# Altium schematic sheet MLX_Thermometer.SchDoc
size 635 x 599 mm
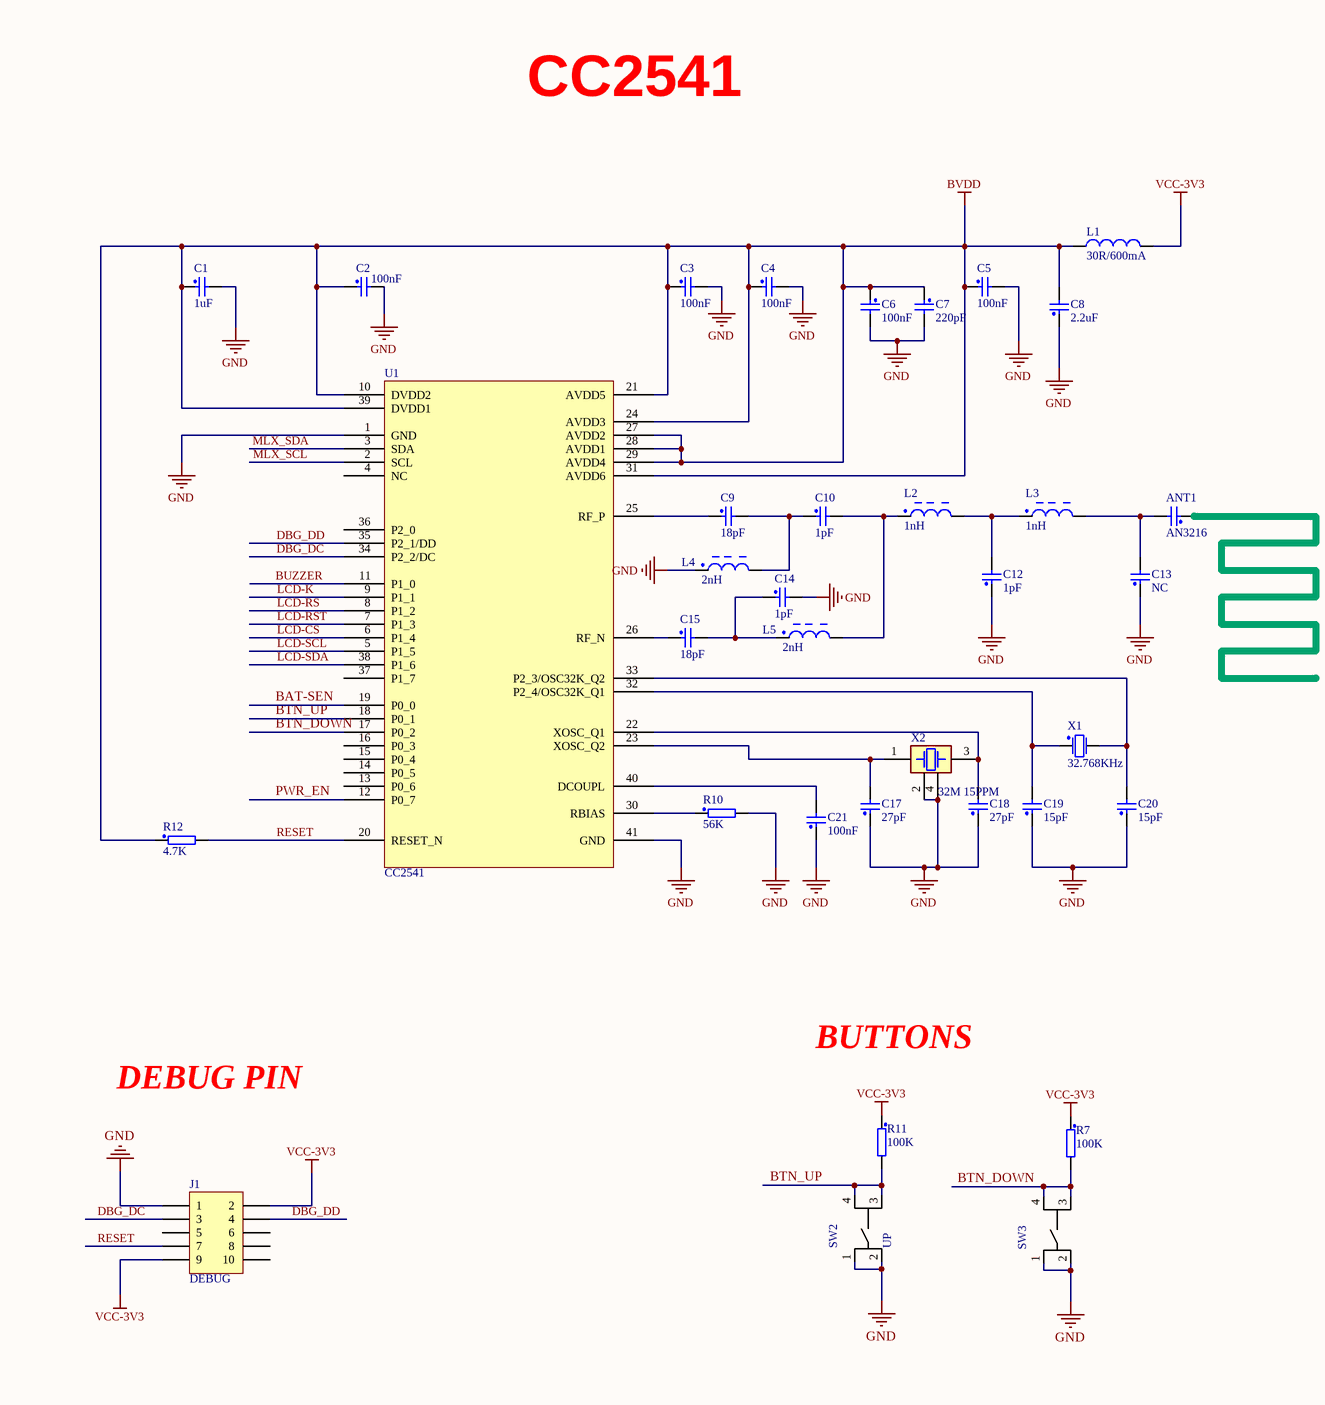
[diagram p0: MLX_Thermometer.SchDoc, top left]
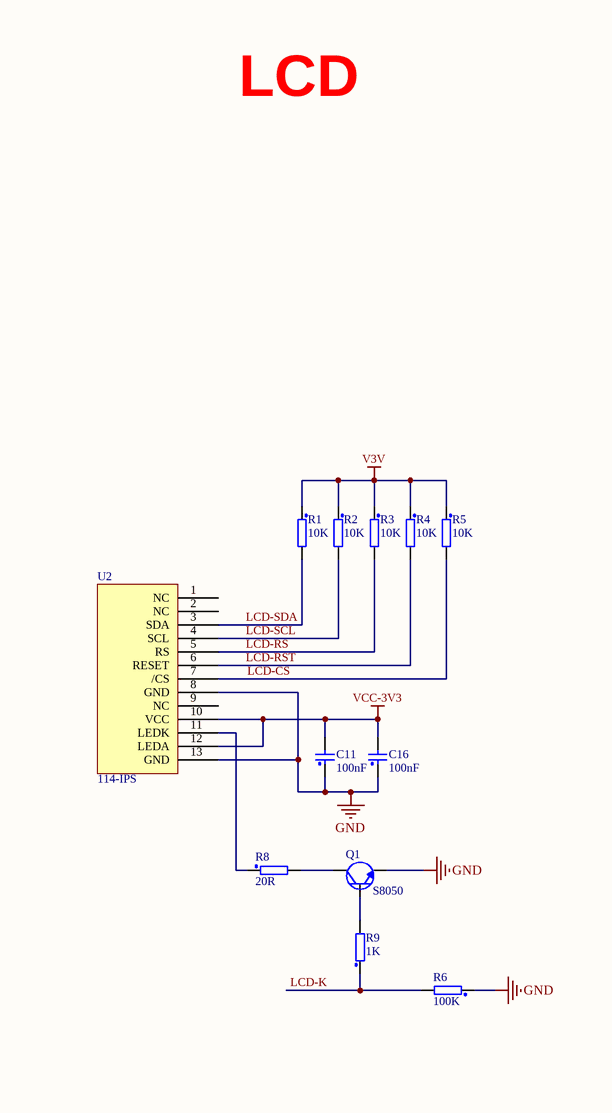
[diagram p1: MLX_Thermometer.SchDoc, top right]
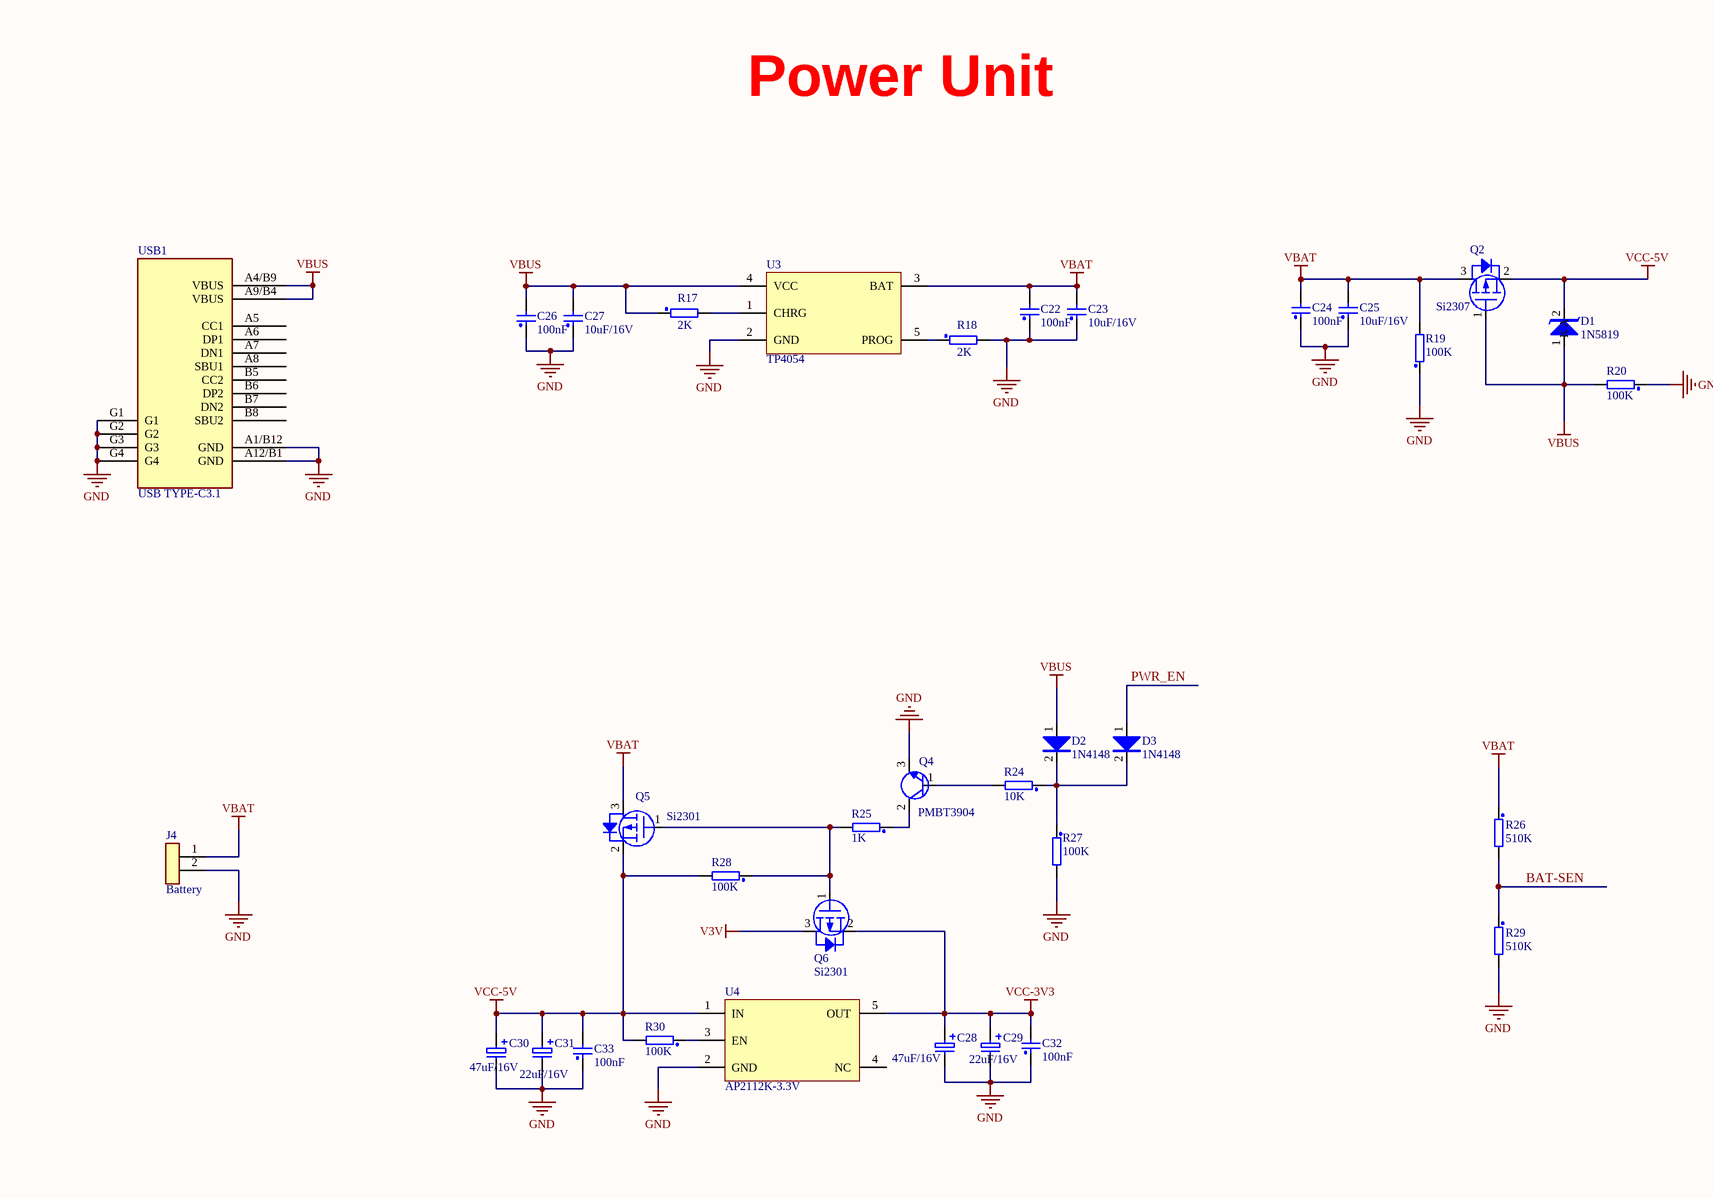
[diagram p2: MLX_Thermometer.SchDoc, bottom left]
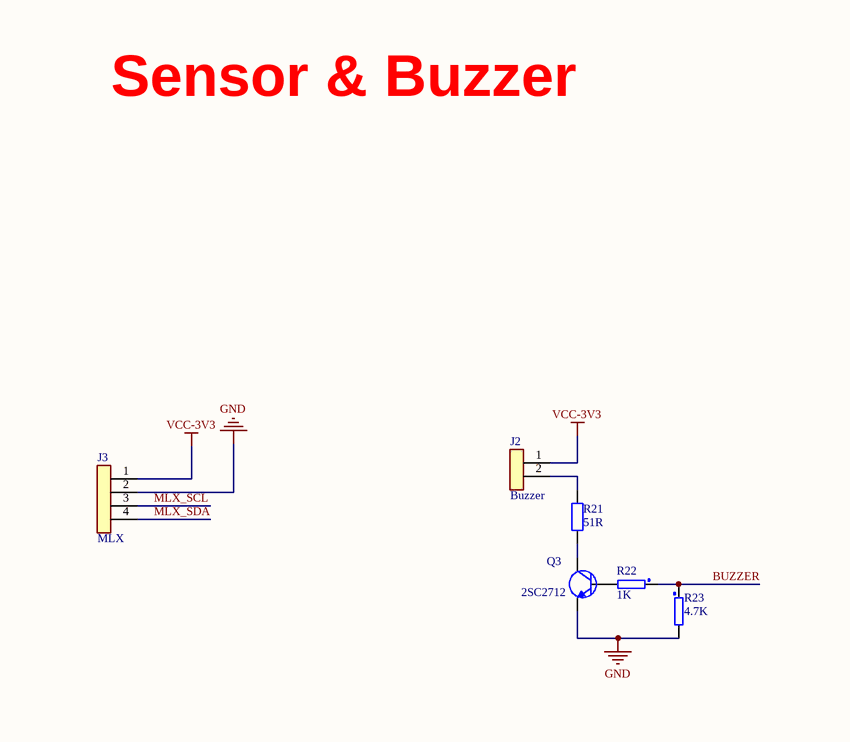
[diagram p3: MLX_Thermometer.SchDoc, bottom right]

## Parts
ANT1  AN3216  [AN3216]
C1  1uF  [CAP-0402]
C2  100nF  [CAP-0402]
C3  100nF  [CAP-0402]
C4  100nF  [CAP-0402]
C5  100nF  [CAP-0402]
C6  100nF  [CAP-0402]
C7  220pF  [CAP_0402]
C8  2.2uF  [CAP_0402]
C9  18pF  [CAP_0402]
C10  1pF  [CAP_0402]
C11  100nF  [CAP_0402]
C12  1pF  [CAP_0402]
C13  NC  [CAP_0402]
C14  1pF  [CAP_0402]
C15  18pF  [CAP_0402]
C16  100nF  [CAP_0402]
C17  27pF  [CAP_0402]
C18  27pF  [CAP_0402]
C19  15pF  [CAP_0402]
C20  15pF  [CAP_0402]
C21  100nF  [CAP-0402]
C22  100nF  [CAP_0402]
C23  10uF/16V  [CAP-0603]
C24  100nF  [CAP_0402]
C25  10uF/16V  [CAP-0603]
C26  100nF  [CAP_0402]
C27  10uF/16V  [CAP-0603]
C28  47uF/16V  [CAP-1206]
C29  22uF/16V  [CAP-1206]
C30  47uF/16V  [CAP-1206]
C31  22uF/16V  [CAP-1206]
C32  100nF  [CAP_0402]
C33  100nF  [CAP_0402]
D1  1N5819  [SOD523]
D2  1N4148  [SOD523-3D]
D3  1N4148  [SOD523-3D]
J1  DEBUG  [HEADER2X5]
J2  Buzzer  [MX 1.25-WS-2P]
J3  MLX  [MX 1.25-WS-4P]
J4  Battery  [MX 1.25-WS-2P]
L1  30R/600mA  [IND_0805_SMD]
L2  1nH  [Inductor_0402_3D]
L3  1nH  [Inductor_0402_3D]
L4  2nH  [Inductor_0402_3D]
L5  2nH  [Inductor_0402_3D]
Q1  S8050  [SOT23_2]
Q2  Si2307  [SOT23_2]
Q3  2SC2712  [SOT23_2]
Q4  PMBT3904  [SOT23_2]
Q5  Si2301  [SOT23_2]
Q6  Si2301  [SOT23_2]
R1  10K  [RES_0402]
R2  10K  [RES_0402]
R3  10K  [RES_0402]
R4  10K  [RES_0402]
R5  10K  [RES_0402]
R6  100K  [RES_0402]
R7  100K  [RES_0402]
R8  20R  [RES_0402]
R9  1K  [RES_0402]
R10  56K  [RES_0402]
R11  100K  [RES_0402]
R12  4.7K  [RES_0402]
R17  2K  [RES_0402]
R18  2K  [RES_0402]
R19  100K  [RES_0402]
R20  100K  [RES_0402]
R21  51R  [RES_0402]
R22  1K  [RES_0402]
R23  4.7K  [RES_0402]
R24  10K  [RES_0402]
R25  1K  [RES_0402]
R26  510K  [RES_0402]
R27  100K  [RES_0402]
R28  100K  [RES_0402]
R29  510K  [RES_0402]
R30  100K  [RES_0402]
SW2  UP  [SW_TVAF02A]
SW3  DOWN  [SW_TVAF02A]  (value not drawn)
U1  CC2541  [QFN50P600X600-40WL]
U2  114-IPS  [144-IPS]
U3  TP4054  [TP4054]
U4  AP2112K-3.3V  [AP2112K]
USB1  USB TYPE-C3.1  [USB-C]
X1  32.768KHz  [Crystal1206]
X2  32M 15PPM  [CRYSTAL_4-LCC]

## Nets
BVDD: C1.1 C2.1 C3.1 C4.1 C5.1 C6.1 C7.1 C8.2 L1.1 R12.1 U1.10(DVDD2) U1.21(AVDD5) U1.24(AVDD3) U1.27(AVDD2) U1.28(AVDD1) U1.29(AVDD4) U1.31(AVDD6) U1.39(DVDD1)
GND: C1.2 C2.2 C3.2 C4.2 C5.2 C6.2 C7.2 C8.1 C11.1 C12.1 C13.1 C14.2 C16.1 C17.1 C18.1 C19.1 C20.1 C21.1 C22.1 C23.1 C24.1 C25.1 C26.1 C27.1 C28.2 C29.2 C30.2 C31.2 C32.1 C33.1 J1.1 J3.2 J4.2 L4.1 Q1.3(E) Q3.3(E) Q4.3(E) R6.1 R10.2 R18.2 R19.1 R20.1 R23.2 R27.2 R29.2 SW2.1 SW2.2 SW3.1 SW3.2 U1.1(GND) U1.41(GND) U2.8(GND) U2.13(GND) U3.2(GND) U4.2(GND) USB1.A1/B12(GND) USB1.A12/B1(GND) USB1.G1 USB1.G2 USB1.G3 USB1.G4 X2.2 X2.4
V3V: Q6.3 R1.1 R2.1 R3.1 R4.1 R5.1
VBAT: C22.2 C23.2 C24.2 C25.2 J4.1 Q2.3 Q5.3 R19.2 R26.1 U3.3(BAT)
VBUS: C26.2 C27.2 D1.1(A) D2.1 Q2.1 R17.1 R20.2 U3.4(VCC) USB1.A4/B9(VBUS) USB1.A9/B4(VBUS)
VCC-3V3: C11.2 C16.2 C28.1 C29.1 C32.2 J1.2 J1.9 J2.1 J3.1 L1.2 Q6.2 R7.1 R11.1 U2.10(VCC) U2.12(LEDA) U4.5(OUT)
VCC-5V: C30.1 C31.1 C33.2 D1.2(K) Q2.2 Q5.2 R28.2 R30.2 U4.1(IN)
BAT-SEN: R26.2 R29.1 U1.19(P0_0)
BTN_DOWN: R7.2 SW3.3 SW3.4 U1.17(P0_2)
BTN_UP: R11.2 SW2.3 SW2.4 U1.18(P0_1)
BUZZER: R22.1 R23.1 U1.11(P1_0)
DBG_DC: J1.3 U1.34(P2_2/DC)
DBG_DD: J1.4 U1.35(P2_1/DD)
LCD-CS: R5.2 U1.6(P1_4) U2.7(/CS)
LCD-K: R6.2 R9.1 U1.9(P1_1)
LCD-RS: R3.2 U1.8(P1_2) U2.5(RS)
LCD-RST: R4.2 U1.7(P1_3) U2.6(RESET)
LCD-SCL: R2.2 U1.5(P1_5) U2.4(SCL)
LCD-SDA: R1.2 U1.38(P1_6) U2.3(SDA)
MLX_SCL: J3.3 U1.2(SCL)
MLX_SDA: J3.4 U1.3(SDA)
PWR_EN: D3.1 U1.12(P0_7)
RESET: J1.7 R12.2 U1.20(RESET_N)
NetANT1_2: ANT1.2 C13.2 L3.2
NetC9_1: C9.1 U1.25(RF_P)
NetC9_2: C9.2 C10.1 L4.2
NetC10_2: C10.2 L2.1 L5.2
NetC12_2: C12.2 L2.2 L3.1
NetC14_1: C14.1 C15.2 L5.1
NetC15_1: C15.1 U1.26(RF_N)
NetC17_2: C17.2 U1.23(XOSC_Q2) X2.1
NetC18_2: C18.2 U1.22(XOSC_Q1) X2.3
NetC19_2: C19.2 U1.32(P2_4/OSC32K_Q1) X1.1(P1)
NetC20_2: C20.2 U1.33(P2_3/OSC32K_Q2) X1.2(P2)
NetC21_2: C21.2 U1.40(DCOUPL)
NetD2_2: D2.2 D3.2 R24.1 R27.1
NetJ2_2: J2.2 R21.1
NetQ1_1: Q1.1(C) R9.2
NetQ1_2: Q1.2(B) R8.2
NetQ3_1: Q3.1(C) R22.2
NetQ3_2: Q3.2(B) R21.2
NetQ4_1: Q4.1(C) R24.2
NetQ4_2: Q4.2(B) R25.1
NetQ5_1: Q5.1 Q6.1 R25.2 R28.1
NetR8_1: R8.1 U2.11(LEDK)
NetR10_1: R10.1 U1.30(RBIAS)
NetR17_2: R17.2 U3.1(CHRG)
NetR18_1: R18.1 U3.5(PROG)
NetR30_1: R30.1 U4.3(EN)

Not connected (* = marked no-connect by the designer): ANT1 1; J1 5 6 8 10; U1 4(NC) 13(P0_6) 14(P0_5) 15(P0_4) 16(P0_3) 36(P2_0) 37(P1_7); U2 1(NC) 2(NC) 9(NC); U4 4(NC); USB1 A5(CC1) A6(DP1) A7(DN1) A8(SBU1) B5(CC2) B6(DP2) B7(DN2) B8(SBU2)

## Notes on the sheet
- CC2541
- LCD
- BUTTONS
- DEBUG PIN
- Power Unit
- Sensor & Buzzer

## Library data of the parts
ANT1 = CAP: AN3216-245 2.4G BLE Antenna; MF: *; MP: *; Package: *; value: *; TaoBao_Purchase_URL: https://detail.tmall.com/item.htm?spm=a230r.1.14.8.96184f13HPWBwH&id=521488309682&cm_id=140105335569ed55e27b&abbucket=16; Digi-Key_Purchase_URL: *; Digi-Key_Part_Number: *
C1 = CAP: Capacitor; value: 6.3V/iuF; Package: 0402
C2-C6 C21 = CAP: Capacitor; value: 16V/100nF; Package: 0402
C7 = CAP: Capacitor; value: 50V/220pF; Package: 0402
C8 = CAP: Capacitor; value: 6.3V/2.2uF; Package: 0402
C9 C15 = CAP: Capacitor; value: 50V/18pF; Package: 0402
C10 C12 C14 = CAP: Capacitor; value: 50V/1pF; Package: 0402
C11 C16 C19 C20 C22-C27 C32 C33 = CAP: Capacitor; value: 50V/15pF; Package: 0402
C13 = CAP: Capacitor
C17 C18 = CAP: Capacitor; value: 50V/27pF; Package: 0402
C28-C31 = CAP_POLAR: Capacitor; Manufacturer: Vishay Sprague; MPN: T55D107M025C0060; Value: 25V/100uF(T55D107M025C0060); Digi-Key Partnumber: 718-2173-1-ND; Package: 2917 (7343 Metric)
D1 = ZENER: ZENER DIODE; value: BZX585-B9V1; Package: SOD523
D2 D3 = DIODE: DIODE SCHOTTKY; MF: STMicroelectronics; value: 30V/300MA; MP: BAT30KFILM; Digi-Key_Part_Number: 497-5552-2-ND; Package: SOD523; Digi-Key_Purchase_URL: https://www.digikey.com/product-detail/en/stmicroelectronics/BAT30KFILM/497-5552-2-ND/1207019; TaoBao_Purchase_URL: https://detail.tmall.com/item.htm?spm=a230r.1.14.1.17442803eJRhGB&id=577412855490&cm_id=140105335569ed55e27b&abbucket=18
J1 = Header2x5
J2 J4 = HEADER2_1
J3 = HEADER4
L1 = Inductor: FIXED IND 4.7UH 600MA 180 MOHM; MF: TDK Corporation; MP: MLZ2012N4R7LT000; Package: 0805 (2012 Metric); value: 4.7UH 600MA; TaoBao_Purchase_URL: https://detail.tmall.com/item.htm?spm=a230r.1.14.1.2e803235NwWsDc&id=524061179119&cm_id=140105335569ed55e27b&abbucket=16; Digi-Key_Purchase_URL: https://www.digikey.com/product-detail/en/tdk-corporation/MLZ2012N4R7LT000/445-6760-2-ND/2523498; Digi-Key_Part_Number: 445-6760-2-ND
L2 L3 = INDUCTOR: FIXED IND 1NH 1.2A 30 MOHM SMD; MF: TDK Corporation; MP: MHQ1005P1N0BT000; value: 1nH±0.1nH; Package: 0402 (1006 Metric); Digi-Key_Part_Number: 445-175574-2-ND; Digi-Key_Purchase_URL: https://www.digikey.com/product-detail/en/tdk-corporation/MHQ1005P1N0BT000/445-175574-2-ND/4742515; TaoBao_Purchase_URL: https://detail.tmall.com/item.htm?spm=a230r.1.14.21.1a71364fWEdiUS&id=577554439239&ns=1&abbucket=16
L4 L5 = INDUCTOR: FIXED IND 2NH 900MA 150 MOHM SMD; MF: TDK Corporation; MP: MLG1005S2N0BT000; value: 2nH ±0.1nH; Package: 0402 (1005 Metric); TaoBao_Purchase_URL: https://detail.tmall.com/item.htm?spm=a230r.1.14.1.11227b88Hif0cT&id=558199830076&cm_id=140105335569ed55e27b&abbucket=16; Digi-Key_Purchase_URL: https://www.digikey.com/product-detail/en/tdk-corporation/MLG1005S2N0BT000/445-16277-2-ND/4742727; Digi-Key_Part_Number: 445-16277-2-ND
Q1 Q4 = NPN: NPN BJT; Manufacturer: Toshiba Semiconductor and Storage; MPN: 2SC2712-GR,LF; TemperatureRange: 125°C (TJ); Value: 2SC2712-GR,LF; AN: *; Hight: *; Design Comment: *; Partgroup: *; Supplier_1: Digi-Key; Supplier_1_PN: 2SC2712-GRLFCT-ND; Supplier_2: Farnell; Supplier_2_PN: *; Package: SOT-23-3; Taobao_URL: https://detail.tmall.com/item.htm?spm=a230r.1.14.35.444f2c38iRqyPU&id=520601925531&ns=1&abbucket=7
Q2 Q5 Q6 = MOS-P-D: P-Channel Mosfet 20V/4.3A; Manufacturer: Alpha & Omega Semiconductor Inc.; MPN: AO3401A; TemperatureRange: -55°C ~ 150°C (TJ); Value: AO3407A; AN: *; Hight: *; Design Comment: *; Partgroup: *; Supplier_1: Digi-Key; Supplier_1_PN: 785-1001-1-ND; Supplier_2: Farnell; Supplier_2_PN: *; Package: SOT-23-3; Taobao_URL: https://detail.tmall.com/item.htm?spm=a230r.1.14.13.1b167e0bkw5ajU&id=25040792997&cm_id=140105335569ed55e27b&abbucket=7
Q3 = NPN: NPN BJT
R1-R9 R11 R17-R20 R24 R25 R27 R28 R30 = RES: Resistor; Manufacturer: Yageo; MPN: RC0402FR-071KL; Hight: 0.016" (0.40mm); TemperatureRange: -55°C ~ 155°C; Value: 1K ±1%; AN: *; Design Comment: *; Partgroup: *; Supplier_1: Digi-Key; Supplier_1_PN: 311-1.00KLRTR-ND; Supplier_2: Farnell; Supplier_2_PN: *; Package: 0402; Taobao_URL: *
R10 = RES: Resistor; value: 56K± 1%; Package: 0402
R12 = RES: Resistor; value: 4.7K± 1%; Package: 0402
R21 = Res2: Resistor; Published: 8-Jun-2000; LatestRevisionDate: 17-Jul-2002; LatestRevisionNote: Re-released for DXP Platform.; PackageReference: AXIAL-0.4; Publisher: Altium Limited
R22 R23 = RES: Resistor
R26 R29 = RES: Resistor; value: 510K± 1%; Package: 0402; Digi-Key_Purchase_URL: **; Digi-Key_Part_Number: ***; TaoBao_Purchase_URL: *
SW2 SW3 = 1-1825910-4: Tactile Switch SPST-NO Top Actuated Surface Mount; MP: PTS810 SJM 250 SMTR LFS; MF: C&K; Package: Tape & Reel (TR); Digi-Key_Purchase_URL: https://www.digikey.com/product-detail/en/c-k/PTS810-SJM-250-SMTR-LFS/CKN10502TR-ND/4176610; Digi-Key_Part_Number: CKN10502TR-ND; TaoBao_Purchase_URL: https://item.taobao.com/item.htm?spm=a230r.1.14.15.fa6569a9PYJGfN&id=559379919837&ns=1&abbucket=18#detail
U1 = CC2541: IC RF TXRX+MCU BLUETOOTH 40VFQFN; MF: Texas Instruments; MP: CC2541F256RHAR; value: CC2541F256; Package: 40-VFQFN Exposed Pad; Digi-Key_Part_Number: 296-37144-2-ND; Digi-Key_Purchase_URL: https://www.digikey.com/product-detail/en/texas-instruments/CC2541F256RHAR/296-37144-2-ND/3030900; TaoBao_Purchase_URL: https://detail.tmall.com/item.htm?spm=a230r.1.14.1.64d0617eBmgGPQ&id=39306964037&cm_id=140105335569ed55e27b&abbucket=16
U2 = 114-IPS: 1.14 TFT IPS
USB1 = USB TYPE-C3.1: CONN RCP USB3.1 TYPEC SMD; TaoBao_Purchase_URL: https://item.taobao.com/item.htm?spm=a230r.1.14.1.6a515b38czXcyl&id=573090887123&ns=1&abbucket=18#detail; MP: *; MF: *; Digi-Key_Part_Number: *; Digi-Key_Purchase_URL: *; value: *; Package: *
X1 = CRYSTAL: CRYSTAL 32.7680 KHZ 12.5PF SMD; MF: EPSON; MP: FC-135 32.7680KA-A5; value: 32.768kHz ±20ppm Crystal 12.5pF 70 kOhms 2-SMD, No Lead; Package: 2-SMD, No Lead; Digi-Key_Part_Number: SER4103TR-ND; Digi-Key_Purchase_URL: https://www.digikey.com/product-detail/en/epson/FC-135-32.7680KA-A5/SER4103TR-ND/5259895; TaoBao_Purchase_URL: https://detail.tmall.com/item.htm?spm=a230r.1.14.8.4c95162a2M8nmo&id=575447265602&cm_id=140105335569ed55e27b&abbucket=16
X2 = CRYSTAL_40M: CRYSTAL 32.0000MHZ 10PF SMD; MF: EPSON; MP: FA-20H 32.0000MF20X-K3; value: 32MHz ±10ppm Crystal 10pF 50 Ohms 4-SMD, No Lead; Digi-Key_Part_Number: SER3801TR-ND; Digi-Key_Purchase_URL: https://www.digikey.com/product-detail/en/epson/FA-20H-32.0000MF20X-K3/SER3801TR-ND/3198120; Package: 4-SMD, No Lead; TaoBao_Purchase_URL: https://detail.tmall.com/item.htm?spm=a230r.1.14.1.75ea703cAfFakI&id=570931117323&cm_id=140105335569ed55e27b&abbucket=16